# Altium schematic sheet 03.Communicate.SchDoc: 03.Communicate
size A4; Revision: V2.0; SheetNumber: 3; SheetTotal: 5; Project: TC264
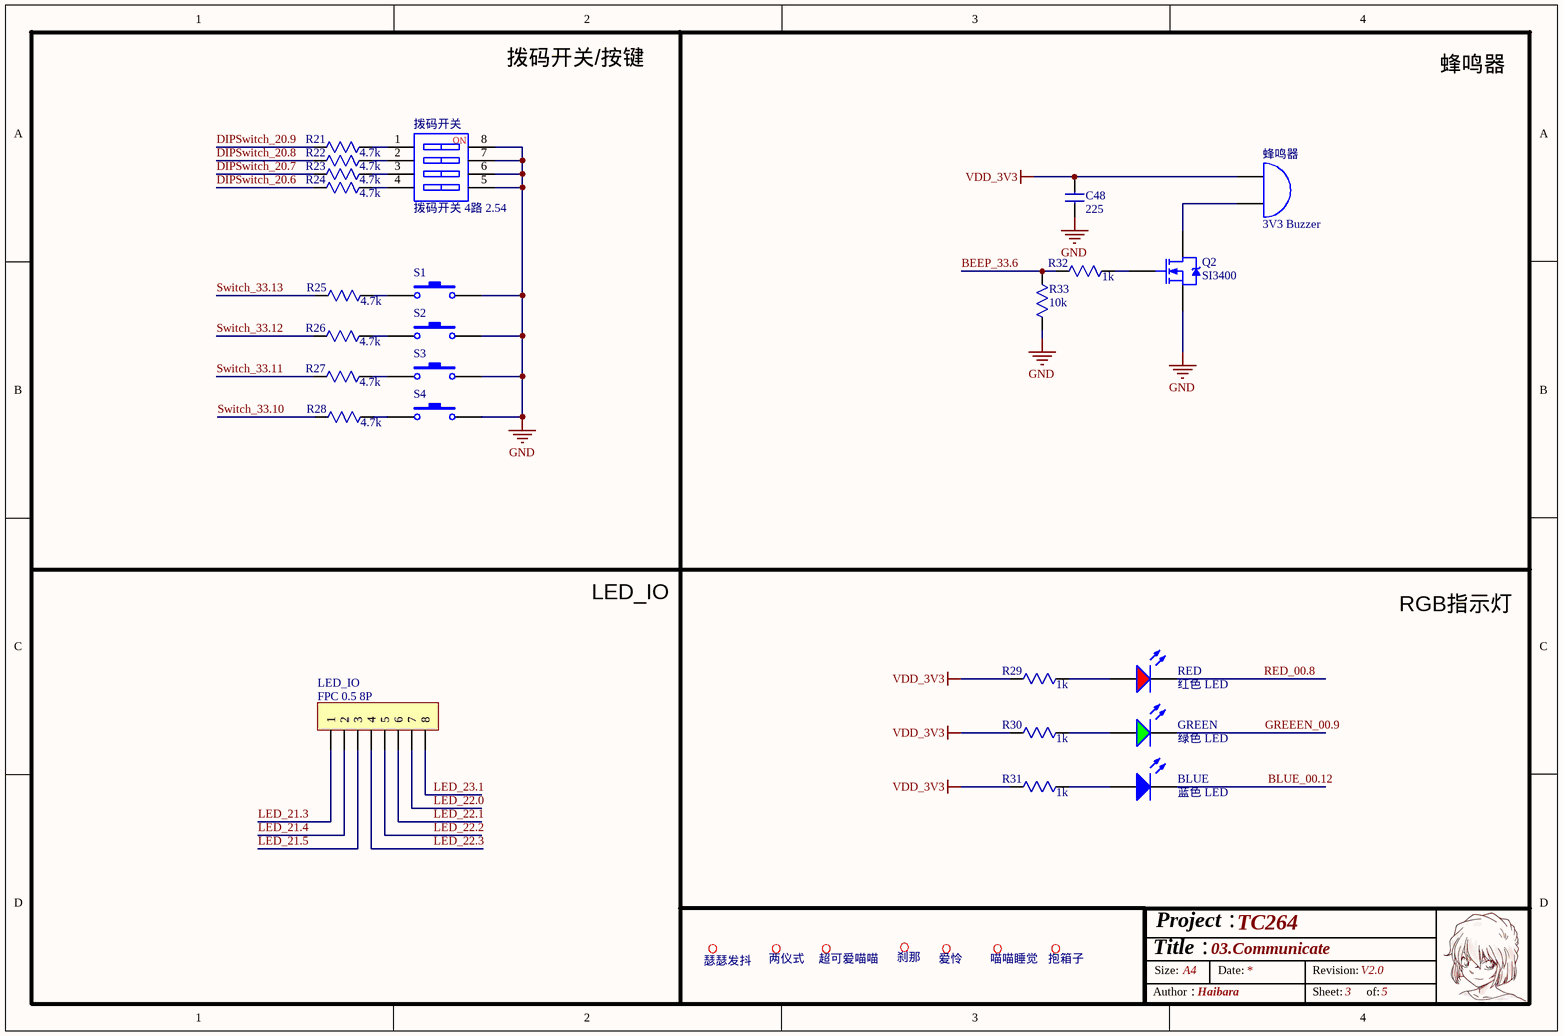
[diagram p0: 03.Communicate.SchDoc]

## Parts
(Parts that share a designator on the sheet are numbered #1, #2 ... from top to bottom, then left to right.)
?#1  瑟瑟发抖  [IMPORTED_IMAGE - duplicate6]
?#2  两仪式  [两仪式]
?#3  超可爱喵喵  [喵喵]
?#4  刹那  [刹那]
?#5  爱怜  [爱怜]
?#6  喵喵睡觉  [喵喵睡觉]
?#7  抱箱子  [抱箱子_大]
BLUE  蓝色 LED  [0603 LED B]
C48  225  [C0603]
GREEN  绿色 LED  [0603 LED G]
LED_IO  FPC 0.5 8P  [FPC0.5 2H-WS-8P]
Q2  SI3400  [SOT-23]
R21  4.7k  [R0603]
R22  4.7k  [R0603]
R23  4.7k  [R0603]
R24  4.7k  [R0603]
R25  4.7k  [R0603]
R26  4.7k  [R0603]
R27  4.7k  [R0603]
R28  4.7k  [R0603]
R29  1k  [R0603]
R30  1k  [R0603]
R31  1k  [R0603]
R32  1k  [R0603]
R33  10k  [R0603]
RED  红色 LED  [0603 LED R]
S1  SW-PB  [TSW SMD-3*6*2.5]  (value not drawn)
S2  SW-PB  [TSW SMD-3*6*2.5]  (value not drawn)
S3  SW-PB  [TSW SMD-3*6*2.5]  (value not drawn)
S4  SW-PB  [TSW SMD-3*6*2.5]  (value not drawn)
拨码开关  拨码开关 4路 2.54  [CSW DIP-2P_G]
蜂鸣器  3V3 Buzzer  [贴片有源蜂鸣器 9.6x9.6x5]

## Nets
GND: C48.2 Q2.2(S) R33.1 S1.2 S2.2 S3.2 S4.2 拨码开关.5 拨码开关.6 拨码开关.7 拨码开关.8
VDD_3V3: C48.1 R29.1 R30.1 R31.1 蜂鸣器.1(A)
BEEP_33.6: R32.1 R33.2
BLUE_00.12: BLUE.2
DIPSwitch_20.6: R24.1
DIPSwitch_20.7: R23.1
DIPSwitch_20.8: R22.1
DIPSwitch_20.9: R21.1
GREEEN_00.9: GREEN.2
LED_21.3: LED_IO.1
LED_21.4: LED_IO.2
LED_21.5: LED_IO.3
LED_22.0: LED_IO.7
LED_22.1: LED_IO.6
LED_22.2: LED_IO.5
LED_22.3: LED_IO.4
LED_23.1: LED_IO.8
RED_00.8: RED.2
Switch_33.10: R28.1
Switch_33.11: R27.1
Switch_33.12: R26.1
Switch_33.13: R25.1
NetBLUE_1: BLUE.1 R31.2
NetGREEN_1: GREEN.1 R30.2
NetQ2_1: Q2.1(G) R32.2
NetQ2_3: Q2.3(D) 蜂鸣器.2(B)
NetR21_2: R21.2 拨码开关.1
NetR22_2: R22.2 拨码开关.2
NetR23_2: R23.2 拨码开关.3
NetR24_2: R24.2 拨码开关.4
NetR25_2: R25.2 S1.1
NetR26_2: R26.2 S2.1
NetR27_2: R27.2 S3.1
NetR28_2: R28.2 S4.1
NetR29_2: R29.2 RED.1

## Notes on the sheet
- 拨码开关/按键
- 蜂鸣器
- LED_IO
- RGB指示灯
- Title：
- Size:
- Project：
- A4
- Date:
- Revision:
- Author：
- Haibara
- Sheet:
- of:
- (in symbol CSW-4P) NO

## Library data of the parts
BLUE = 蓝灯: 发光二极管; ComponentLink1Description: 供应商链接; ComponentLink1URL: http://www.szlcsc.com/product/details_2666.html; Package: 0805; Supplier: LC; SuppliersPartNumber: C2293
C48 = 电容
GREEN = 绿灯: 发光二极管; ComponentLink1Description: 供应商链接; ComponentLink1URL: http://www.szlcsc.com/product/details_2670.html; Package: 0805; Supplier: LC; SuppliersPartNumber: C2297
LED_IO = Header 8: 8P接插件; 版权归属: 封装库来自淘宝 ID：黄晶宝石; BOM名称: 8P接插件; 学习资源: https://shop463601444.taobao.com
Q2 = NMOS: N-Channel Power MOSFET 40V 100A 1.8mΩ; Note: Pin 2 is electrically connected to pin 4.; Published: 8-Jun-2000; LatestRevisionDate: 17-Jul-2002; LatestRevisionNote: Re-released for DXP Platform.; DatasheetVersion: PD-9.814; PackageVersion: Feb-1997; PackageReference: TO-220AB; Publisher: Altium Limited; PackageDescription: TO, Thru-Hole, Vertical, Heatsink Mounted; 3 In-Line Leads; Pitch 2.54 mm; ComponentLink1Description: Manufacturer Link; ComponentLink1URL: http://www.irf.com/
R21-R33 = 电阻
RED = 红灯: 发光二极管; ComponentLink1Description: 供应商链接; ComponentLink1URL: http://www.szlcsc.com/product/details_2668.html; Package: 0805; Supplier: LC; SuppliersPartNumber: C2295
S1-S4 = SW-PB: Switch; Published: 24-Mar-1999; LatestRevisionDate: 17-Jul-2002; LatestRevisionNote: Re-released for DXP Platform.; PackageReference: SPST-2; Publisher: Altium Limited; PackageDescription: Switch; 2 Leads
拨码开关 = CSW-4P: 4路编码开关; 版权归属: 源创客; BOM名称: 4路编码开关; 学习资源: www.ooocke.com
蜂鸣器 = Bell: Electrical Bell; Published: 24-Mar-1999; LatestRevisionDate: 17-Jul-2002; LatestRevisionNote: Re-released for DXP Platform.; PackageReference: PIN2; Publisher: Altium Limited